# Altium schematic sheet SimplicityExpansion.SchDoc
size A4
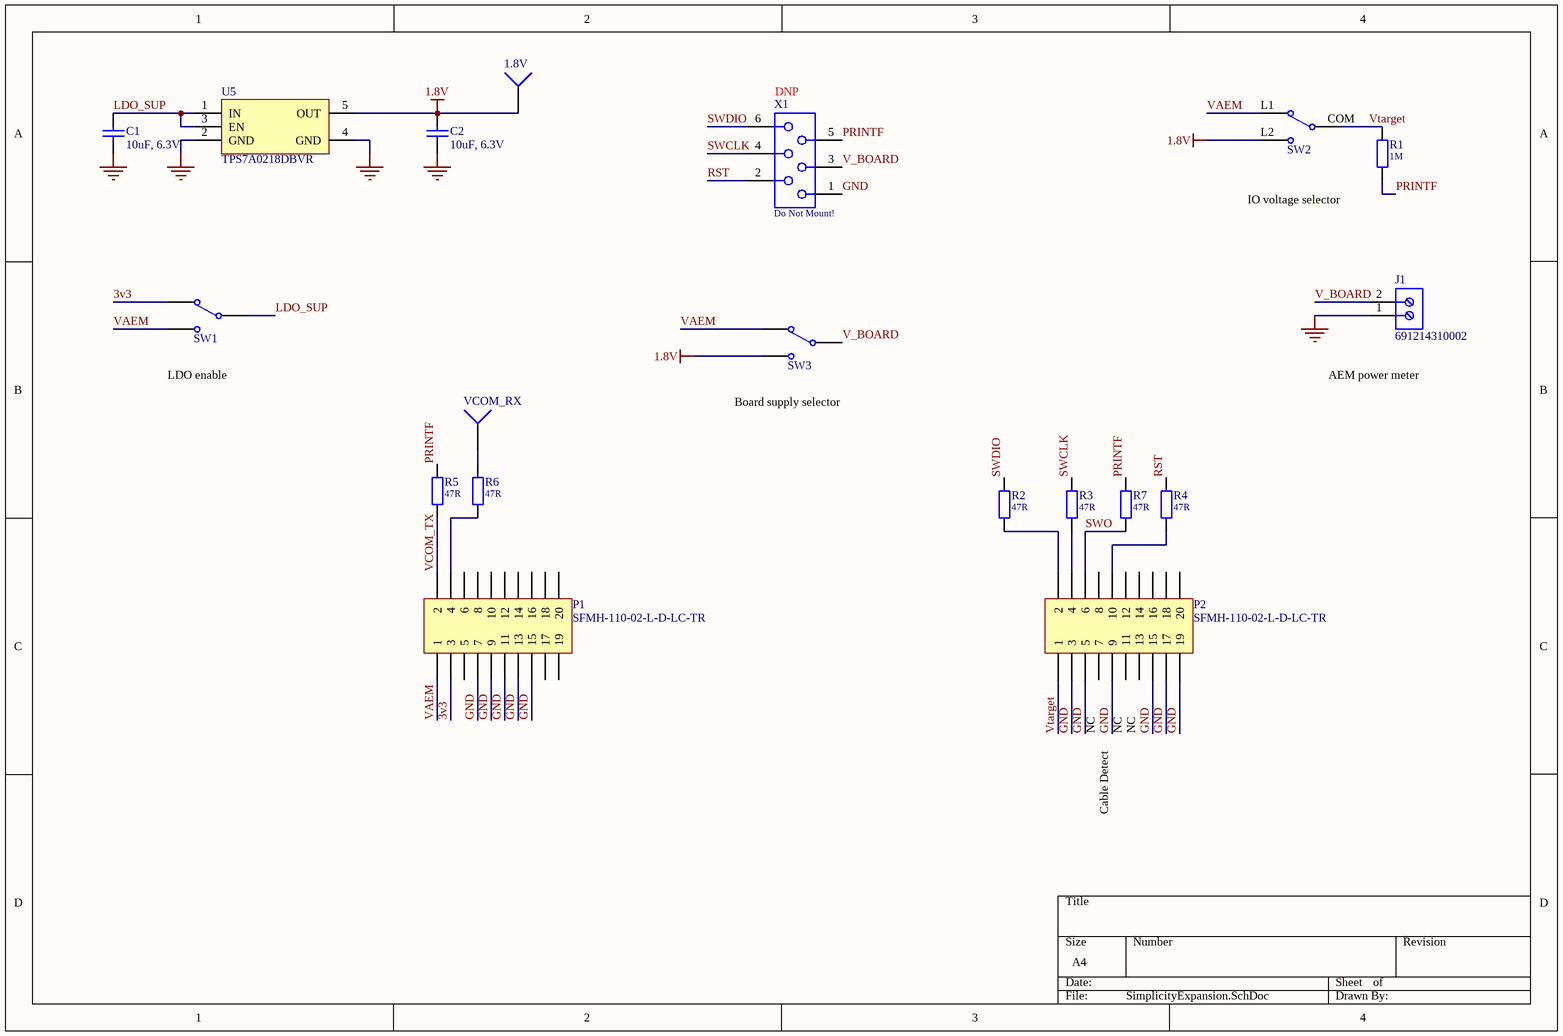
[diagram p0: SimplicityExpansion.SchDoc]

## Parts
1.8V  VCOM_RX  [PIN1]  (value not drawn)  (no BOM)
C1  value 10uF, 6.3V  [C SMD Ceramic 0603]  (hidden comment: 885012106006)
C2  value 10uF, 6.3V  [C SMD Ceramic 0603]  (hidden comment: 885012106006)
J1  691214310002  [691214310002]
P1  SFMH-110-02-L-D-LC-TR  [SFMH-110-02-L-D-LC-TR]
P2  SFMH-110-02-L-D-LC-TR  [SFMH-110-02-L-D-LC-TR]
R1  value 1M  [R SMD 0603 1%]  (hidden comment: CRCW06031M00FKTABC)
R2  value 47R  [R SMD 0603 1%]  (hidden comment: ERJ-3EKF47R0V)
R3  value 47R  [R SMD 0603 1%]  (hidden comment: ERJ-3EKF47R0V)
R4  value 47R  [R SMD 0603 1%]  (hidden comment: ERJ-3EKF47R0V)
R5  value 47R  [R SMD 0603 1%]  (hidden comment: ERJ-3EKF47R0V)
R6  value 47R  [R SMD 0603 1%]  (hidden comment: ERJ-3EKF47R0V)
R7  value 47R  [R SMD 0603 1%]  (hidden comment: Do Not Mount)
SW1  450405020524  [450405020524]  (value not drawn)
SW2  450405020524  [450405020524]  (value not drawn)
SW3  450405020524  [450405020524]  (value not drawn)
U5  TPS7A0218DBVR  [SOT23-5BL]
VCOM_RX  VCOM_RX  [PIN1]  (value not drawn)  (no BOM)
X1  Do Not Mount!  [490107670612_Permanent Application]  (no BOM)

## Nets
1.8V: 1.8V.1 C2.1 SW2.L2 SW3.L2 U5.5(OUT)
GND: C1.2 C2.2 J1.1 P1.7 P1.9 P1.11 P1.13 P1.15 P2.3 P2.5 P2.9 P2.15 P2.17 P2.19 U5.2(GND) U5.4(GND) X1.1
3v3: P1.3 SW1.L1
LDO_SUP: C1.1 SW1.COM U5.1(IN) U5.3(EN)
PRINTF: R1.2 R5.2 R7.2 X1.5
RST: R4.2 X1.2
SWCLK: R3.2 X1.4
SWDIO: R2.2 X1.6
SWO: P2.6 R7.1
V_BOARD: J1.2 SW3.COM X1.3
VAEM: P1.1 SW1.L2 SW2.L1 SW3.L1
VCOM_TX: P1.2 R5.1
Vtarget: P2.1 R1.1 SW2.COM
NetP1_4: P1.4 R6.1
NetP2_2: P2.2 R2.1
NetP2_4: P2.4 R3.1
NetP2_10: P2.10 R4.1
NetR6_2: R6.2 VCOM_RX.1

Not connected (* = marked no-connect by the designer): P1 5 6 8 10 12 14 16 17 18 19 20; P2 7 8 11 12 13 14 16 18 20

## Notes on the sheet
- (near X1) DNP
- IO voltage selector
- (near SW1) LDO enable
- AEM power meter
- (near SW3) Board supply selector
- NC
- Cable Detect

## Library data of the parts
1.8V VCOM_RX = Socket
C1 C2 = 885012105012: 10uF, 6.3V, 0603, X5R, 20%; Manufacturer: Wurth Elektronik; Part Number: 885012106006; Price 1: 0.01; Price 100: 0.01; Price 1000: 0.01
J1 = 691214310002: WR-TBL Serie 2143 Horizontal Entry Modular, Rising Cage Clamp, pitch 3.81mm, 2p; Manufacturer: Wurth Elektronik; Compliance: Lead free / RoHS; Modularity: Yes; PCB/Cable/Panel: PCB; Pin Number: 2; Rated Current [UL]: 10A; Working Voltage [UL]: 300VAC; ComponentLink1Description: Manufacturer; ComponentLink1URL: http://www.we-online.de; ComponentLink2URL: https://katalog.we-online.de/em/datasheet/691214310002.pdf; ComponentLink2Description: Datasheet; Mounting Technology: THT; Part Number: 691214310002; Packaging: Box; Operating Temperature: -40 to +105degC; Pitch: 3.81mm; Published Date: October 2019; Type: Horizontal; Application: Rising Cage Clamp
P1 P2 = Header 10X2: Header, 10-Pin, Dual row; Manufacturer: Samtec; Part Number: SFMH-110-02-L-D-LC-TR; Price 1: 5.93; Price 100: 4.35; Price 1000: 3.94
R1 = Resistor: 1MOhm, 50 V, 0603, 100 mW, ± 1%; Manufacturer: VISHAY; Part Number: CRCW06031M00FKTABC; Price 1: 0.0123; Price 100: 0.0123; Price 1000: 0.0026
R2-R7 = Resistor: 47R, 50 V, 0603, 100mW, ±1%; Manufacturer: PANASONIC; Price 1: 0.09; Price 100: 0.015; Price 1000: 0.009
  R2-R6: Part Number: ERJ-3EKF47R0V
  R7: Part Number: Do Not Mount
SW1-SW3 = 450405020524: WS-SLSU SMT Mini Slide Switch Same Side Connection, SPDT, 5VDC, 300mA, 225g; Manufacturer: Wurth Elektronik; ComponentLink1Description: Website Link; ComponentLink1URL: https://www.we-online.com/redexpert/article/450405020524?ad; ComponentLink2Description: Datasheet Link; ComponentLink2URL: https://www.we-online.com/redexpert/spec/450405020524?ad; Part Number: 450405020524; Category: Slide Switches; Match Code: WS-SLSU; Mount: Surface Mount; Operating Temperature Max: 85°C; Operating Temperature Min: -40°C; Packaging: Tape and Reel; Length: 8.7mm; Width: 3mm; Height: 2mm; Circuit: SPDT; Contact Material: Copper Alloy; Contact Plating: Silver; Operation Force: 225g; Rated Current: 300mA; Rated Voltage: 5VDC; Terminal Material: Copper Alloy; Terminal Plating: Silver; Price 1: 0.91; Price 100: 0.81; Price 1000: 0.7
U5 = TPS783xx: 200mA, nanopower-IQ (25 nA), low-dropout (LDO) voltage regulator with enable; Manufacturer: Texas Instruments; Price 1: 0.915; Price 100: 0.64; Price 1000: 0.417; Part Number: TPS7A0218DBVR
X1 = 490107670612: WR-WST REDFIT IDC SKEDD, pitch 2.54mm, 6pins; Pin Number: 6; Rated Current: 1A; Working Voltage: 100V(AC); Contact Resistance max.: 10mOhm; Gender: Transition; ComponentLink1Description: Manufacturer; ComponentLink1URL: http://www.we-online.de; ComponentLink2Description: Datasheet; ComponentLink2URL: https://katalog.we-online.com/em/datasheet/490107670612.pdf; Part Number: 490107670612; Published Date: November 2019; Publisher: Wurth Elektronik; Pitch: 2.54mm; Operating Temperature: -25 to +105degC; Mounting Technology: Press-In; Packaging: Tube